# Altium project ArmBand-Control-Board.PrjPcb (part 1 of 3)
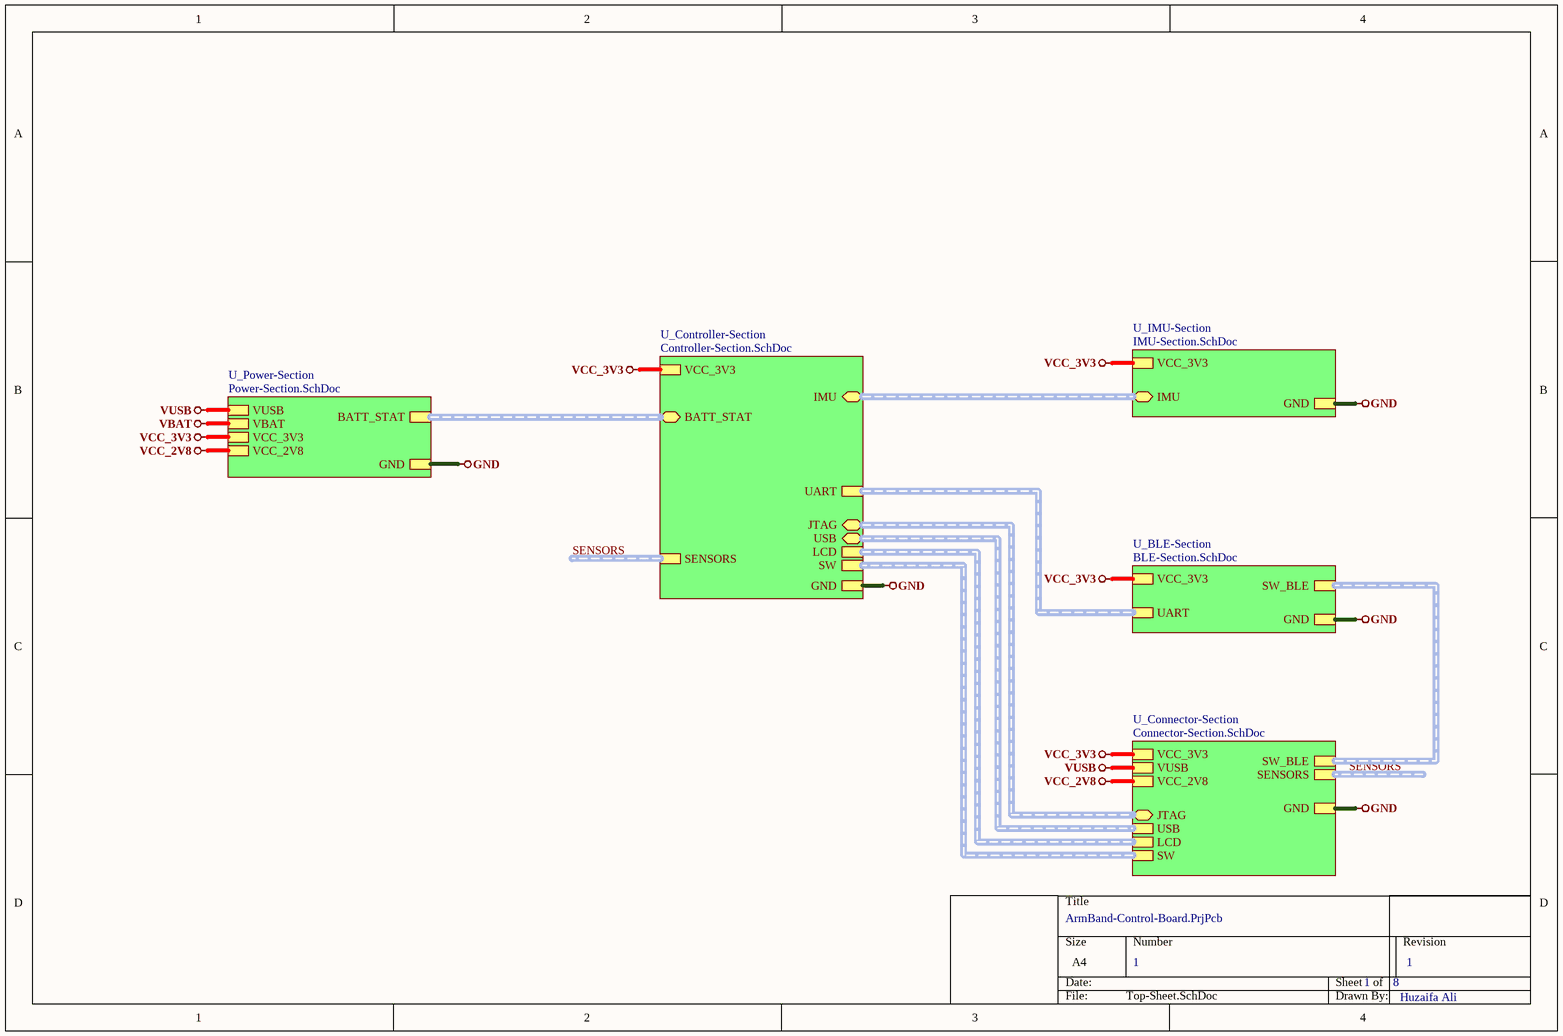
[diagram p0: Top-Sheet.SchDoc]
8 sheets, 111 parts. Net scope: hierarchical (ports join the sheet entries above them; power ports are global).
Board file: ArmBand-Control-Board.PcbDoc
Sheets:
  Top-Sheet.SchDoc
    U_Power-Section = Power-Section.SchDoc
      U_Switching-Regulators = Switching-Regulators.SchDoc
      U_Battery-Charging-Section = Battery-Charging-Section.SchDoc
    U_Controller-Section = Controller-Section.SchDoc
    U_IMU-Section = IMU-Section.SchDoc
    U_BLE-Section = BLE-Section.SchDoc
    U_Connector-Section = Connector-Section.SchDoc

## Sheet Top-Sheet.SchDoc
size A4; SheetNumber: 1; SheetTotal: 8

### Sub-sheets
U_BLE-Section = BLE-Section.SchDoc: UART (harness UART), SW_BLE (harness SW_BLE), VCC_3V3, GND
U_Connector-Section = Connector-Section.SchDoc: SW_BLE (harness SW_BLE), USB (harness USB), VCC_3V3, GND, VUSB, JTAG (bidir, harness JTAG), LCD (harness LCD), SENSORS (harness SENSORS), VCC_2V8, SW (harness SW)
U_Controller-Section = Controller-Section.SchDoc: BATT_STAT (bidir, harness BATT_STAT), IMU (bidir, harness IMU), USB (bidir, harness USB), VCC_3V3, GND, UART (harness UART), JTAG (bidir, harness JTAG), LCD (harness LCD), SENSORS (harness SENSORS), SW (harness SW)
U_IMU-Section = IMU-Section.SchDoc: IMU (bidir, harness IMU), VCC_3V3, GND
U_Power-Section = Power-Section.SchDoc: VUSB, GND, VBAT, VCC_3V3, BATT_STAT (harness BATT_STAT), VCC_2V8

### Nets
GND: sheet U_Power-Section/GND, sheet U_Controller-Section/GND, sheet U_IMU-Section/GND, sheet U_BLE-Section/GND, sheet U_Connector-Section/GND
VCC_2V8: sheet U_Power-Section/VCC_2V8, sheet U_Connector-Section/VCC_2V8
VCC_3V3: sheet U_Power-Section/VCC_3V3, sheet U_Controller-Section/VCC_3V3, sheet U_IMU-Section/VCC_3V3, sheet U_BLE-Section/VCC_3V3, sheet U_Connector-Section/VCC_3V3
VUSB: sheet U_Power-Section/VUSB, sheet U_Connector-Section/VUSB

### Buses and harness runs
harness SENSORS = sheet U_Connector-Section/SENSORS
harness SENSORS = sheet U_Controller-Section/SENSORS
harness sheet U_BLE-Section/SW_BLE = sheet U_Connector-Section/SW_BLE
harness sheet U_BLE-Section/UART = sheet U_Controller-Section/UART
harness sheet U_Connector-Section/JTAG = sheet U_Controller-Section/JTAG
harness sheet U_Connector-Section/LCD = sheet U_Controller-Section/LCD
harness sheet U_Connector-Section/SW = sheet U_Controller-Section/SW
harness sheet U_Connector-Section/USB = sheet U_Controller-Section/USB
harness sheet U_Controller-Section/BATT_STAT = sheet U_Power-Section/BATT_STAT
harness sheet U_Controller-Section/IMU = sheet U_IMU-Section/IMU

### Notes on the sheet
- 1
- Huzaifa Ali

## Sheet Power-Section.SchDoc
size A4; SheetNumber: 2; SheetTotal: 8
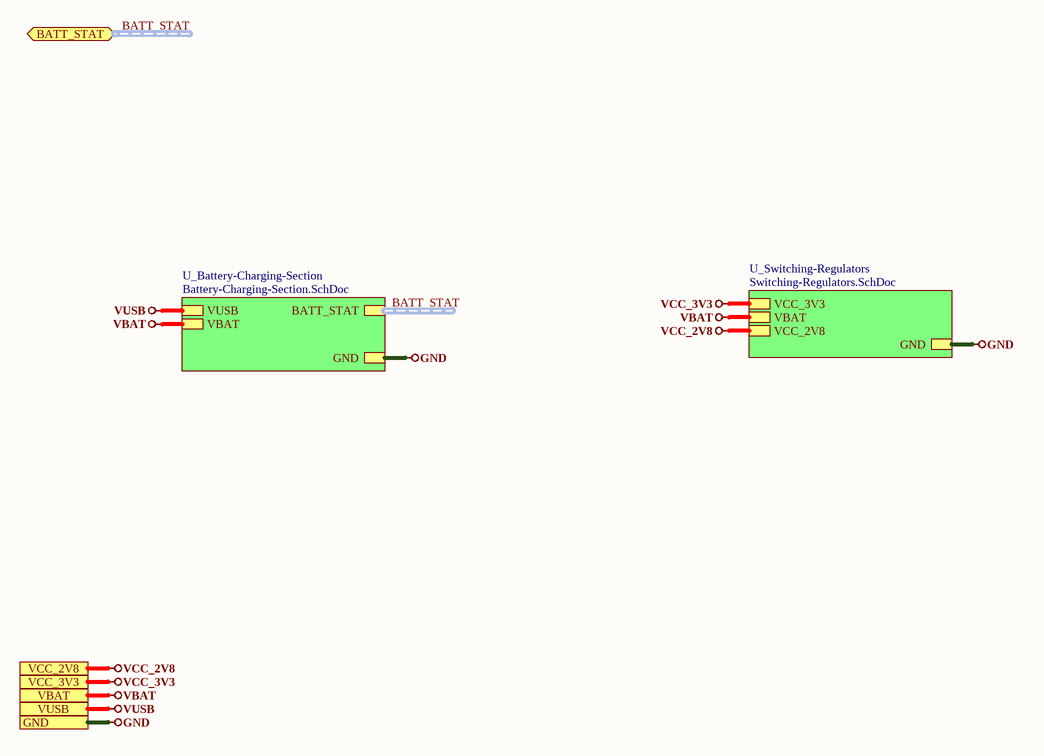
[diagram p1: Power-Section.SchDoc]

### Sub-sheets
U_Battery-Charging-Section = Battery-Charging-Section.SchDoc: BATT_STAT (harness BATT_STAT), VUSB, GND, VBAT
U_Switching-Regulators = Switching-Regulators.SchDoc: VCC_3V3, GND, VBAT, VCC_2V8

### Ports
BATT_STAT (bidir, harness BATT_STAT), GND, VBAT, VCC_2V8, VCC_3V3, VUSB

### Nets
GND: port GND, sheet U_Switching-Regulators/GND, sheet U_Battery-Charging-Section/GND
VBAT: port VBAT, sheet U_Switching-Regulators/VBAT, sheet U_Battery-Charging-Section/VBAT
VCC_2V8: port VCC_2V8, sheet U_Switching-Regulators/VCC_2V8
VCC_3V3: port VCC_3V3, sheet U_Switching-Regulators/VCC_3V3
VUSB: port VUSB, sheet U_Battery-Charging-Section/VUSB

### Buses and harness runs
harness BATT_STAT = port BATT_STAT
harness BATT_STAT = sheet U_Battery-Charging-Section/BATT_STAT

### Notes on the sheet
- 1
- Huzaifa Ali

## Sheet Switching-Regulators.SchDoc
size A4; SheetNumber: 4; SheetTotal: 8
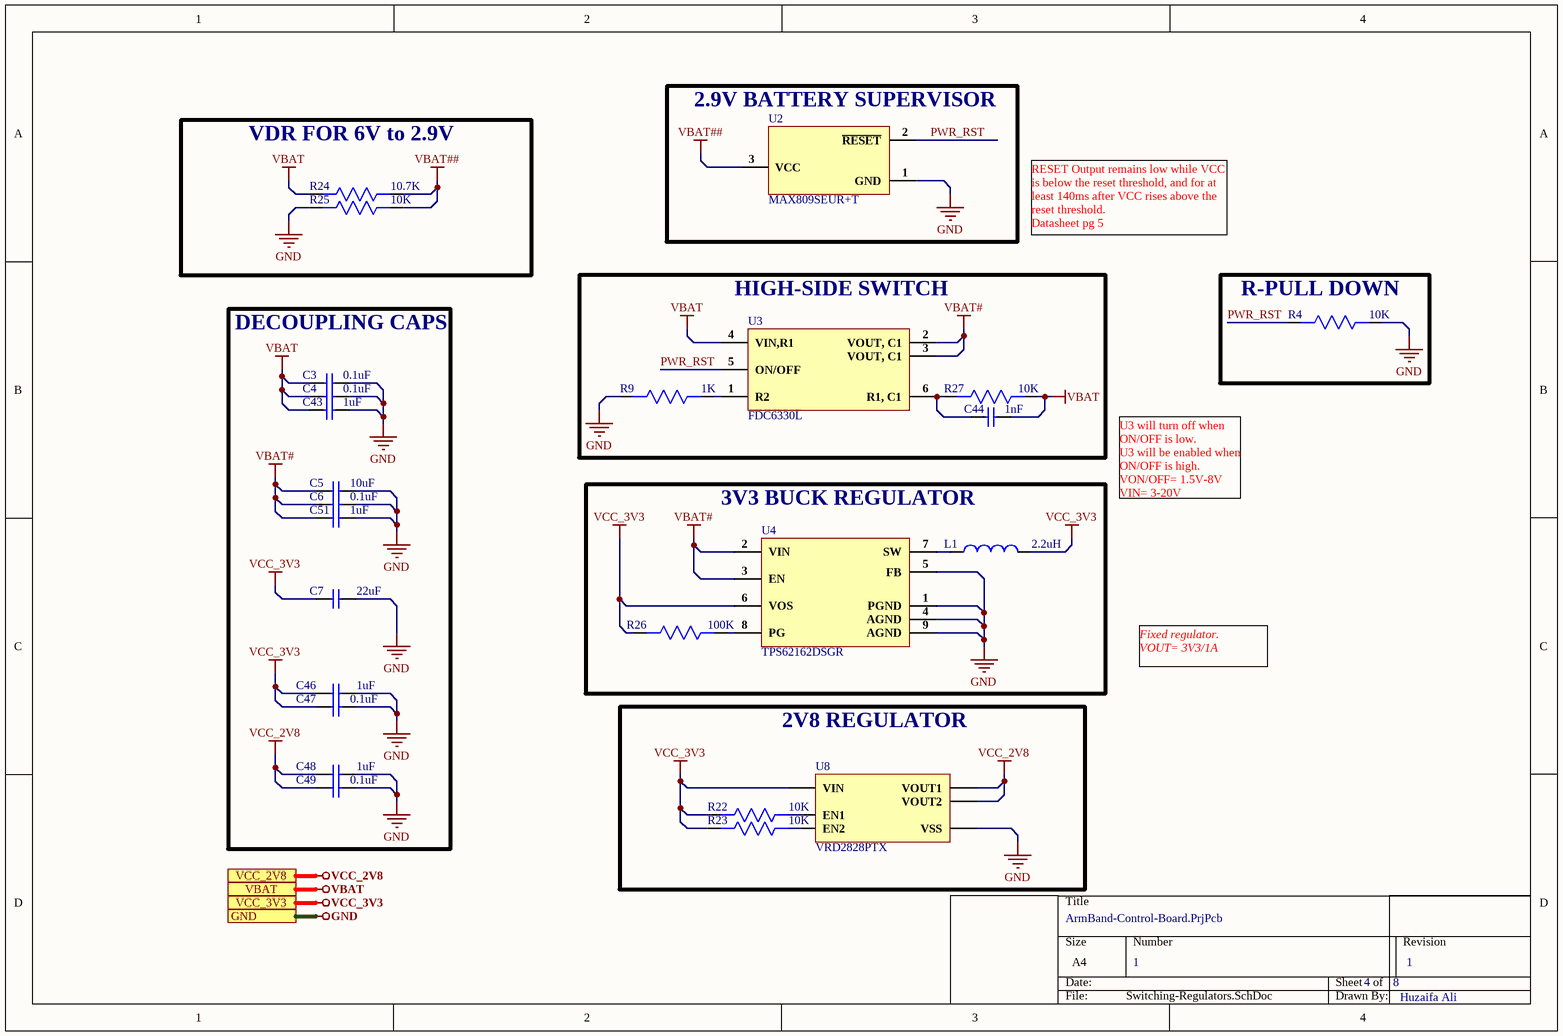
[diagram p2: Switching-Regulators.SchDoc]

### Parts
C3  0.1uF  [Cap 0402]
C4  0.1uF  [Cap 0402]
C5  10uF  [Cap0603]
C6  0.1uF  [Cap 0402]
C7  22uF  [Cap0805]
C43  1uF  [Cap 0402]
C44  1nF  [Cap 0402]
C46  1uF  [Cap 0402]
C47  0.1uF  [Cap 0402]
C48  1uF  [Cap 0402]
C49  0.1uF  [Cap 0402]
C51  1uF  [Cap 0402]
L1  2.2uH  [MAKK2016T2R2M]
R4  10K  [Res0402]
R9  1K  [Res0402]
R22  10K  [Res0402]
R23  10K  [Res0402]
R24  10.7K  [Res0402]
R25  10K  [Res0402]
R26  100K  [Res0402]
R27  10K  [Res0402]
U2  MAX809SEUR+T  [SOT-23]
U3  FDC6330L  [SuperSOT™-6]
U4  TPS62162DSGR  [8-WSON (2x2)]
U8  VRD2828PTX  [SOT-23-6]

### Blocks framed on the sheet
2.9V BATTERY SUPERVISOR: U2
VDR FOR 6V to 2.9V: R24 R25
HIGH-SIDE SWITCH: C44 R9 R27 U3
R-PULL DOWN: R4
DECOUPLING CAPS: C3-C7 C43 C46-C49 C51
3V3 BUCK REGULATOR: L1 R26 U4
2V8 REGULATOR: R22 R23 U8

### Ports
GND, VBAT, VCC_2V8, VCC_3V3

### Nets
GND: C3.2 C4.2 C5.2 C6.2 C7.2 C43.2 C46.2 C47.2 C48.2 C49.2 C51.2 R4.1 R9.2 R25.2 U2.1(GND) U4.1(PGND) U4.4(AGND) U4.5(FB) U4.9(AGND) U8.5(VSS) ; port GND
VBAT: C3.1 C4.1 C43.1 C44.2 R24.2 R27.1 U3.4(VIN,R1) ; port VBAT
VBAT#: C5.1 C6.1 C51.1 U3.2(VOUT,_C1) U3.3(VOUT,_C1) U4.2(VIN) U4.3(EN)
VBAT##: R24.1 R25.1 U2.3(VCC)
VCC_2V8: C48.1 C49.1 U8.4(VOUT2) U8.6(VOUT1) ; port VCC_2V8
VCC_3V3: C7.1 C46.1 C47.1 L1.2 R22.1 R23.1 R26.2 U4.6(VOS) U8.2(VIN) ; port VCC_3V3
PWR_RST: R4.2 U2.2(~{RESET}) U3.5(ON/OFF)
NetC44_1: C44.1 R27.2 U3.6(R1,_C1)
NetL1_1: L1.1 U4.7(SW)
NetR9_1: R9.1 U3.1(R2)
NetR22_2: R22.2 U8.1(EN1)
NetR23_2: R23.2 U8.3(EN2)
NetR26_1: R26.1 U4.8(PG)

### Notes on the sheet
- RESET Output remains low while VCC
  is below the reset threshold, and for at
  least 140ms after VCC rises above the
  reset threshold.
  Datasheet pg 5
- U3 will turn off when ON/OFF is low.
  U3 will be enabled when ON/OFF is high.
  VON/OFF= 1.5V-8V
  VIN= 3-20V
- Fixed regulator.
  VOUT= 3V3/1A
- 1
- Huzaifa Ali

### Library data of the parts
C3 C4 C6 C47 C49 = GRM155R71H104ME14D: CAP CER 0.1UF 50V X7R 0402; Manufacturer: Murata; Tolerance: 20%; Capacitance: 100nF; Supplier 1: Digi-Key; Manufacturer Part Number: GRM155R71H104ME14D; Stock 1: 439844; Pricing 1: 1=0.1, 10=0.038, 100=0.0168, 500=0.01198, 1000=0.00941, 2500=0.00855, 5000=0.00787 (USD); Mount: Surface Mount; Case/Package: 0402; Min Operating Temperature: -55°C; Max Operating Temperature: 125°C; Packaging: Cut Tape; Voltage Rating: 50V; Length: 0.039inch; Width: 0.02inch; Thickness: 0.022inch; ComponentLink1URL: http://search.murata.co.jp/Ceramy/image/img/A01X/G101/ENG/GRM155R71H104ME14-01.pdf?src-supplier=Digi-Key; ComponentLink1Description: http://search.murata.co.jp/Ceramy/image/img/A01X/G101/ENG/GRM155R71H104ME14-01.pdf?src-supplier=Digi-Key; ComponentLink2URL: http://psearch.en.murata.com/capacitor/product/GRM155R71H104ME14%23.pdf?src-supplier=Avnet; ComponentLink2Description: http://psearch.en.murata.com/capacitor/product/GRM155R71H104ME14%23.pdf?src-supplier=Avnet; ComponentLink3URL: http://components.arrow.com/part/dataview/0323_07177683?src-supplier=Arrow+Europe; ComponentLink3Description: http://components.arrow.com/part/dataview/0323_07177683?src-supplier=Arrow+Europe; ComponentLink4URL: http://www.mouser.com/ds/2/281/c02e-2905.pdf?src-supplier=Mouser; ComponentLink4Description: http://www.mouser.com/ds/2/281/c02e-2905.pdf?src-supplier=Mouser; Supplier Part Number 1: 490-10701-1-ND
C5 = CL10A106MA8NRNC: CAP CER 10UF 25V X5R 0603; Manufacturer: Samsung; Tolerance: 20%; Supplier 1: Avnet; Manufacturer Part Number: CL10A106MA8NRNC; RoHS: Yes; Category: Ceramic Capacitors; Pricing 1: 4000=0.03753, 8000=0.03700, 16000=0.03595, 24000=0.03515, 32000=0.03383, 40000=0.03304, 400000=0.03225 (USD); Mount: Surface Mount; Case/Package: 0603; Case Code (Metric): 1608; Case Code (Imperial): 0603; Contact Plating: Tin; Min Operating Temperature: -55°C; Max Operating Temperature: 85°C; Package Quantity: 1; Packaging: Tape and Reel; Capacitance: 10uF; Voltage Rating: 25V; Dielectric: X5R; Termination: Wraparound; Series: CL; Construction: Flat; Length: 0.063inch; Width: 0.031inch; Thickness: 0.035inch; Lead Free: Lead Free; RoHS Compliant: Yes; ComponentLink1URL: https://datasheet.ciiva.com/25766/cl10a106ma8nrnc-25766562.pdf?src-supplier=Digi-Key; ComponentLink1Description: https://datasheet.ciiva.com/25766/cl10a106ma8nrnc-25766562.pdf?src-supplier=Digi-Key; Supplier Part Number 1: CL10A106MA8NRNC
C7 = GRM21BR61E226ME44L: CAP CER 22UF 25V X5R 0805; Manufacturer: Murata; Material: Ceramic; Tolerance: 20%; Supplier 1: Arrow Electronics; Manufacturer Part Number: GRM21BR61E226ME44L; RoHS: Yes; Category: Ceramic Capacitors; Stock 1: 21193; Pricing 1: 1=0.45930, 10=0.35000, 25=0.33950, 50=0.26910, 100=0.22090, 250=0.21320, 500=0.16760, 1000=0.14640, 3000=0.11710, 6000=0.10550, 15000=0.10450 (USD); Mount: Surface Mount; Case/Package: 0805; Case Code (Metric): 2012; Case Code (Imperial): 0805; Weight: 0.000335oz; Min Operating Temperature: -55°C; Max Operating Temperature: 85°C; Capacitance: 22uF; Voltage Rating: 25V; Packaging: Tape and Reel; Dielectric: X5R; Voltage: 25V; Termination: SMD/SMT; Resistor Type: Ceramic; Voltage Rating (DC): 25V; Package Quantity: 3000; Series: GRM; Construction: Flat; Length: 2mm; Width: 1.25mm; Height: 1.25mm; Thickness: 0.057inch; Depth: 1.25mm; REACH SVHC: No SVHC; Lead Free: Lead Free; RoHS Compliant: Yes; ComponentLink1URL: https://datasheet.ciiva.com/22787/1747471-22787265.pdf?src-supplier=Farnell; ComponentLink1Description: https://datasheet.ciiva.com/22787/1747471-22787265.pdf?src-supplier=Farnell; ComponentLink2URL: https://datasheet.ciiva.com/7719/1747471-7719095.pdf?src-supplier=Element14; ComponentLink2Description: https://datasheet.ciiva.com/7719/1747471-7719095.pdf?src-supplier=Element14; ComponentLink3URL: https://datasheet.ciiva.com/28584/1747471-28584199.pdf?src-supplier=Element14; ComponentLink3Description: https://datasheet.ciiva.com/28584/1747471-28584199.pdf?src-supplier=Element14; Supplier Part Number 1: GRM21BR61E226ME44L
C43 C46 C48 C51 = CC0402KRX5R7BB105: CAP CER 1UF 16V X5R 0402; Manufacturer: Yageo; Tolerance: 10%; Supplier 1: Digi-Key; Manufacturer Part Number: CC0402KRX5R7BB105; Stock 1: 1405667; Pricing 1: 1=0.36, 10=0.252, 100=0.1512, 500=0.1134, 1000=0.09576, 2500=0.09072, 5000=0.08568 (USD); Mount: Surface Mount; Case/Package: 0402; Weight: 2.3E-05oz; Case Code (Imperial): 0402; Case Code (Metric): 1005; Min Operating Temperature: -55°C; Max Operating Temperature: 85°C; Capacitance: 1uF; Dielectric: X5R; Packaging: Tape and Reel; Voltage Rating (DC): 16V; Voltage Rating: 16V; Termination: SMD/SMT; Composition: Ceramic; Length: 1mm; Height: 0.5mm; Width: 0.02inch; Thickness: 0.022inch; Depth: 0.5mm; Radiation Hardening: No; Lead Free: Lead Free; Halogen Free: Halogen Free; ComponentLink1URL: http://www.yageo.com/documents/recent/UPY-GPHC_X5R_4V-to-50V_12.pdf?src-supplier=Avnet+Europe; ComponentLink1Description: http://www.yageo.com/documents/recent/UPY-GPHC_X5R_4V-to-50V_12.pdf?src-supplier=Avnet+Europe; Supplier Part Number 1: 311-1691-6-ND
C44 = CC0402KRX7R8BB102: CAP CER 1000PF 25V X7R 0402; Manufacturer: Yageo; Tolerance: 10%; Dissipation Factor: 2.5%; Insulation Resistance: 10GR; Supplier 1: Arrow Electronics; Manufacturer Part Number: CC0402KRX7R8BB102; RoHS: Yes; Category: Ceramic Capacitors; Stock 1: 370000; Pricing 1: 1=0.00230, 10000=0.00230, 100001=0.00190 (USD); Mount: Surface Mount; Case/Package: 0402; Number of Pins: 2; Case Code (Imperial): 0402; Case Code (Metric): 1005; Min Operating Temperature: -55°C; Max Operating Temperature: 125°C; Capacitance: 1nF; Packaging: Tape and Reel; Voltage Rating: 25V; Dielectric: X7R; Termination: SMD/SMT; Voltage Rating (DC): 25V; Series: CC; Length: 1mm; Width: 0.02inch; Thickness: 0.022inch; Depth: 0.5mm; Radiation Hardening: No; Lead Free: Lead Free; Halogen Free: Halogen Free; RoHS Compliant: Yes; ComponentLink1URL: https://datasheet.ciiva.com/26862/getdatasheetpartid-639817-26862638.pdf?src-supplier=Verical; ComponentLink1Description: https://datasheet.ciiva.com/26862/getdatasheetpartid-639817-26862638.pdf?src-supplier=Verical; ComponentLink2URL: https://datasheet.ciiva.com/5425/upy-gp-np0-16v-to-50v-8-3714-5425527.pdf?src-supplier=Mouser; ComponentLink2Description: https://datasheet.ciiva.com/5425/upy-gp-np0-16v-to-50v-8-3714-5425527.pdf?src-supplier=Mouser; Supplier Part Number 1: CC0402KRX7R8BB102
L1 = MAKK2016T2R2M: FIXED IND 2.2UH 1.5A 160MOHM SMD; Manufacturer: Taiyo Yuden; Core Material: Metal; Tolerance: 20%; Shielding: Shielded; DC Resistance (DCR): 160mR; Test Frequency: 2MHz; Supplier 1: Mouser; Manufacturer Part Number: MAKK2016T2R2M; RoHS: Yes; Category: Fixed Inductors; Stock 1: 64320; Pricing 1: 1=0.27000, 10=0.17200, 50=0.17200, 100=0.14000, 1000=0.10600, 10000=0.09200 (USD); Mount: Surface Mount; Case/Package: 0806; Case Code (Metric): 2016; Case Code (Imperial): 0806; Min Operating Temperature: -40°C; Max Operating Temperature: 105°C; Packaging: Tape and Reel; Package Quantity: 3000; Resistor Type: Wirewound; Inductance: 2.2uH; Current Rating: 1.5A; Saturation Current: 1.5A; Max DC Current: 1.5A; Termination: SMD/SMT; Length: 0.079inch; Width: 0.063inch; Height: 1mm; Height - Seated (Max): 0.039inch; Depth: 1.6mm; Radiation Hardening: No; Halogen Free: Halogen Free; RoHS Compliant: Yes; ComponentLink1URL: https://datasheet.ciiva.com/30014/makk2016t2r2m-ss-30014449.pdf?src-supplier=Avnet; ComponentLink1Description: https://datasheet.ciiva.com/30014/makk2016t2r2m-ss-30014449.pdf?src-supplier=Avnet; Supplier Part Number 1: 963-MAKK2016T2R2M
R4 R22 R23 R25 R27 = RC0402FR-0710KL: RES SMD 10K OHM 1% 1/16W 0402; Manufacturer: Yageo; Resistance: 10kR; Temperature Coefficient: 100ppm/°C; Voltage Rating (DC): 50V; Power Rating: 62.5mW; Supplier 1: Digi-Key; Manufacturer Part Number: RC0402FR-0710KL; Stock 1: 60122563; Pricing 1: 1=0.1, 10=0.016, 100=0.0064, 1000=0.00289, 2500=0.00251, 5000=0.00207 (USD); Case/Package: 0402; Number of Pins: 2; Case Code (Imperial): 0402; Case Code (Metric): 1005; Min Operating Temperature: -55°C; Max Operating Temperature: 155°C; Composition: Thick Film; Tolerance: 1%; Packaging: Tape and Reel; Voltage Rating: 50V; Termination: SMD/SMT; Military Standard: Not; Working Voltage: 50V; Number of Terminations: 2; Length: 1mm; Height: 0.32mm; Width: 0.5mm; Depth: 0.5mm; Lead Pitch: 0.2mm; REACH SVHC: No SVHC; Lead Free: Lead Free; ComponentLink1URL: http://www.farnell.com/datasheets/2167052.pdf?src-supplier=Element14; ComponentLink1Description: http://www.farnell.com/datasheets/2167052.pdf?src-supplier=Element14; ComponentLink2URL: http://www.farnell.com/datasheets/1686128.pdf?src-supplier=Element14; ComponentLink2Description: http://www.farnell.com/datasheets/1686128.pdf?src-supplier=Element14; ComponentLink3URL: http://www.farnell.com/datasheets/1784430.pdf?src-supplier=Element14; ComponentLink3Description: http://www.farnell.com/datasheets/1784430.pdf?src-supplier=Element14; ComponentLink4URL: http://www.yageo.com/documents/recent/PYu-RC_Group_51_RoHS_L_9.pdf?src-supplier=Mouser; ComponentLink4Description: http://www.yageo.com/documents/recent/PYu-RC_Group_51_RoHS_L_9.pdf?src-supplier=Mouser; Supplier Part Number 1: 311-10.0KLRDKR-ND
R9 = RC0402JR-071KL: RES 1K OHM 5% 1/16W 0402; Manufacturer: Yageo; Resistance: 1kR; Power Rating: 62.5mW; Voltage Rating: 50V; Temperature Coefficient: 100ppm/°C; Max Power Dissipation: 63mW; Supplier 1: Digi-Key; Manufacturer Part Number: RC0402JR-071KL; RoHS: Yes; Category: Chip SMD Resistors; Stock 1: 452315; Pricing 1: 1=0.10000, 10=0.01300, 100=0.00540, 1000=0.00244, 2500=0.00212, 5000=0.00175 (USD); Case/Package: 0402; Case Code (Imperial): 0402; Case Code (Metric): 1005; Size Code: 0402; Min Operating Temperature: -55°C; Max Operating Temperature: 155°C; Tolerance: 5%; Packaging: Tape and Reel; Package Quantity: 1; Termination: SMD/SMT; Resistor Type: Thick Film; Number of Terminations: 2; Features: Moisture Resistant; Series: RC; Resistance Tolerance: 5%; Construction: Rectangular; Length: 0.039inch; Width: 0.02inch; Height: 0.016inch; Depth: 0.5mm; REACH SVHC: No SVHC; Military Standard: Not; Lead Free: Lead Free; RoHS Compliant: Yes; ComponentLink1URL: https://datasheet.ciiva.com/7983/1018594-7983558.pdf?src-supplier=Element14; ComponentLink1Description: https://datasheet.ciiva.com/7983/1018594-7983558.pdf?src-supplier=Element14; ComponentLink2URL: https://datasheet.ciiva.com/2452/pyu-r-int-thick-7-2452756.pdf?src-supplier=Digi-Key; ComponentLink2Description: https://datasheet.ciiva.com/2452/pyu-r-int-thick-7-2452756.pdf?src-supplier=Digi-Key; ComponentLink3URL: https://datasheet.ciiva.com/2452/pyu-r-int-thick-7-2452757.pdf?src-supplier=Digi-Key; ComponentLink3Description: https://datasheet.ciiva.com/2452/pyu-r-int-thick-7-2452757.pdf?src-supplier=Digi-Key; ComponentLink4URL: https://datasheet.ciiva.com/2452/pyu-r-int-thick-7-2452755.pdf?src-supplier=Digi-Key; ComponentLink4Description: https://datasheet.ciiva.com/2452/pyu-r-int-thick-7-2452755.pdf?src-supplier=Digi-Key; ComponentLink5URL: https://datasheet.ciiva.com/7850/1018594-7850170.pdf?src-supplier=Element14; ComponentLink5Description: https://datasheet.ciiva.com/7850/1018594-7850170.pdf?src-supplier=Element14; ComponentLink6URL: https://datasheet.ciiva.com/7850/1018594-7850171.pdf?src-supplier=Element14; ComponentLink6Description: https://datasheet.ciiva.com/7850/1018594-7850171.pdf?src-supplier=Element14; ComponentLink7URL: https://datasheet.ciiva.com/17081/pyu-rc0402-51-rohs-l-6-r-17081438.pdf?src-supplier=Future+Electronics; ComponentLink7Description: https://datasheet.ciiva.com/17081/pyu-rc0402-51-rohs-l-6-r-17081438.pdf?src-supplier=Future+Electronics; Supplier Part Number 1: 311-1.0KJRCT-ND
R24 = AC0402DR-0710K7L: RES SMD 0402 10.7kOhm 0.5% Paper T/R; Manufacturer: Yageo; Supplier 1: Avnet; Manufacturer Part Number: AC0402DR-0710K7L; RoHS: Yes; Category: Chip SMD Resistors; Pricing 1: 10000=0.00820 (USD); RoHS Compliant: Yes; Supplier Part Number 1: AC0402DR-0710K7L
R26 = ERJPA2F1003X: RES SMD 100K OHM 1% 1/5W 0402; Manufacturer: Panasonic; Manufacturer Part Number: ERJ-PA2F1003X; Resistance: 100kR; Power Rating: 200mW; Voltage Rating: 50V; Temperature Coefficient: 100ppm/°C; Supplier 1: Digi-Key; Stock 1: 8829; Pricing 1: 1=0.21, 10=0.175, 100=0.0686, 1000=0.02871, 2500=0.02632, 5000=0.02393 (USD); Case/Package: 0402; Case Code (Metric): 1005; Case Code (Imperial): 0402; Min Operating Temperature: -55°C; Max Operating Temperature: 155°C; Packaging: Cut Tape; Composition: Thick Film; Number of Terminations: 2; Tolerance: 1%; Max Power Dissipation: 200mW; Voltage Rating (DC): 50V; Features: Automotive AEC-Q200; Length: 0.039inch; Height: 0.016inch; Width: 0.02inch; REACH SVHC: Unknown; ComponentLink1URL: http://www.farnell.com/datasheets/2051174.pdf?src-supplier=Element14; ComponentLink1Description: http://www.farnell.com/datasheets/2051174.pdf?src-supplier=Element14; ComponentLink2URL: https://industrial.panasonic.com/ww/system/files/data/download/catalog/id_fixed-resistors_e_1.pdf?src-supplier=Digi-Key; ComponentLink2Description: https://industrial.panasonic.com/ww/system/files/data/download/catalog/id_fixed-resistors_e_1.pdf?src-supplier=Digi-Key; Supplier Part Number 1: P17236CT-ND
U2 = MAX809SEUR+T: IC MPU/RESET CIRC SOT23-3; Manufacturer: Maxim; Min Supply Voltage: 1.2V; Max Supply Voltage: 5.5V; Max Power Dissipation: 320mW; Number of Voltages Monitored: 1; Reset: Active Low; Reset Timeout: 140ms; Threshold Voltage: 2.93V; Watchdog Timer: No; Min Reset Threshold Voltage: 2.89V; Max Reset Threshold Voltage: 2.96V; Output: TOTEM-POLE; Operating Supply Current: 60uA; Max Output Current: 20mA; Nominal Supply Current: 17uA; Output Type: PUSH-PULL; Supplier 1: Mouser; Manufacturer Part Number: MAX809SEUR+T; RoHS: Yes; Category: Voltage Supervisors; Stock 1: 26180; Pricing 1: 1=3.68000, 10=3.31000, 25=3.13000, 50=3.13000, 100=2.72000, 250=2.58000, 500=2.31000, 1000=2.09000, 10000=2.01000 (USD); Mount: Surface Mount; Case/Package: SOT-23; Number of Pins: 3; Min Operating Temperature: -40°C; Max Operating Temperature: 105°C; Type: Simple Reset/Power-On Reset; Packaging: Cut Tape; Package Quantity: 1; Series: -; Overvoltage Threshold: 2.96V; Undervoltage Threshold: 2.89V; Termination: SMD/SMT; Power Dissipation: 320mW; Length: 2.92mm; Width: 1.3mm; Height: 0.94mm; Radiation Hardening: No; Lead Free: Lead Free; RoHS Compliant: Yes; REACH SVHC: No SVHC; ComponentLink1URL: https://datasheet.ciiva.com/1169/max803-max810z-1169879.pdf?src-supplier=Element14; ComponentLink1Description: https://datasheet.ciiva.com/1169/max803-max810z-1169879.pdf?src-supplier=Element14; ComponentLink2URL: https://datasheet.ciiva.com/1169/max803-max810z-1169878.pdf?src-supplier=Element14; ComponentLink2Description: https://datasheet.ciiva.com/1169/max803-max810z-1169878.pdf?src-supplier=Element14; ComponentLink3URL: https://datasheet.ciiva.com/14226/max803-max810z-14226330.pdf?src-supplier=Avnet; ComponentLink3Description: https://datasheet.ciiva.com/14226/max803-max810z-14226330.pdf?src-supplier=Avnet; ComponentLink4URL: https://datasheet.ciiva.com/1973/max803-max810z-1973322.pdf?src-supplier=Digi-Key; ComponentLink4Description: https://datasheet.ciiva.com/1973/max803-max810z-1973322.pdf?src-supplier=Digi-Key; ComponentLink5URL: https://datasheet.ciiva.com/1973/max803-max810z-1973323.pdf?src-supplier=Digi-Key; ComponentLink5Description: https://datasheet.ciiva.com/1973/max803-max810z-1973323.pdf?src-supplier=Digi-Key; ComponentLink6URL: https://datasheet.ciiva.com/1973/max803-max810z-1973321.pdf?src-supplier=Digi-Key; ComponentLink6Description: https://datasheet.ciiva.com/1973/max803-max810z-1973321.pdf?src-supplier=Digi-Key; Supplier Part Number 1: 700-MAX809SEURT
U3 = FDC6330L: IC PWR SWITCH P-CH 1:1 SUPERSOT6; Manufacturer: ON Semiconductor / Fairchild; Max Input Voltage: 20V; Number of Outputs: 1; Max Power Dissipation: 700mW; Output Current: 1.6A; Max Output Current: 2.3A; Min Input Voltage: 3V; On-State Resistance: 80mR; Interface: On/Off; Output Configuration: High Side; Supplier 1: Newark; Manufacturer Part Number: FDC6330L; RoHS: Yes; Category: Hot Swap Controllers; Pricing 1: 1=0.70000, 25=0.57700, 50=0.52400, 100=0.47100, 250=0.43700, 500=0.37200, 1000=0.30700 (USD); Mount: Surface Mount; Case/Package: SOT-23-6; Number of Pins: 6; Weight: 0.036g; Min Operating Temperature: -55°C; Max Operating Temperature: 150°C; Packaging: Tape and Reel; Package Quantity: 3000; Operating Supply Voltage: 20V; Max Supply Voltage: 20V; Min Supply Voltage: 3V; Power Rating: 700mW; Current Rating: 2.3A; Power Dissipation: 700mW; Continuous Drain Current (ID): 2.3A; Drain to Source Voltage (Vdss): 20V; Voltage: 20V; Current: 2.3A; Voltage Rating (DC): 20V; Length: 3mm; Width: 1.7mm; Height: 1mm; Radiation Hardening: No; RoHS Compliant: Yes; REACH SVHC: No SVHC; Lead Free: Lead Free; ComponentLink1URL: https://datasheet.ciiva.com/34302/1222713-34302120.pdf?src-supplier=Jameco; ComponentLink1Description: https://datasheet.ciiva.com/34302/1222713-34302120.pdf?src-supplier=Jameco; ComponentLink2URL: https://datasheet.ciiva.com/4898/fdc6330l-102811-4898611.pdf?src-supplier=Mouser; ComponentLink2Description: https://datasheet.ciiva.com/4898/fdc6330l-102811-4898611.pdf?src-supplier=Mouser; ComponentLink3URL: https://datasheet.ciiva.com/1171/fdc6330l-1171185.pdf?src-supplier=Newark; ComponentLink3Description: https://datasheet.ciiva.com/1171/fdc6330l-1171185.pdf?src-supplier=Newark; ComponentLink4URL: https://datasheet.ciiva.com/1572/276121-1572006.pdf?src-supplier=Farnell; ComponentLink4Description: https://datasheet.ciiva.com/1572/276121-1572006.pdf?src-supplier=Farnell; ComponentLink5URL: https://datasheet.ciiva.com/28483/276121-28483263.pdf?src-supplier=Element14; ComponentLink5Description: https://datasheet.ciiva.com/28483/276121-28483263.pdf?src-supplier=Element14; ComponentLink6URL: https://datasheet.ciiva.com/1512/276121-1512459.pdf?src-supplier=Element14; ComponentLink6Description: https://datasheet.ciiva.com/1512/276121-1512459.pdf?src-supplier=Element14; ComponentLink7URL: https://datasheet.ciiva.com/3232/fdc6330l-3232841.pdf?src-supplier=Avnet; ComponentLink7Description: https://datasheet.ciiva.com/3232/fdc6330l-3232841.pdf?src-supplier=Avnet; ComponentLink8URL: https://datasheet.ciiva.com/17090/fdc6330l-17090428.pdf?src-supplier=Future+Electronics; ComponentLink8Description: https://datasheet.ciiva.com/17090/fdc6330l-17090428.pdf?src-supplier=Future+Electronics; ComponentLink9URL: https://datasheet.ciiva.com/3232/fdc6330l-3232552.pdf?src-supplier=Avnet; ComponentLink9Description: https://datasheet.ciiva.com/3232/fdc6330l-3232552.pdf?src-supplier=Avnet; ComponentLink10URL: https://datasheet.ciiva.com/1962/fdc6330l-1962053.pdf?src-supplier=Digi-Key; ComponentLink10Description: https://datasheet.ciiva.com/1962/fdc6330l-1962053.pdf?src-supplier=Digi-Key; ComponentLink11URL: https://datasheet.ciiva.com/1962/fdc6330l-1962054.pdf?src-supplier=Digi-Key; ComponentLink11Description: https://datasheet.ciiva.com/1962/fdc6330l-1962054.pdf?src-supplier=Digi-Key; ComponentLink12URL: https://datasheet.ciiva.com/1962/fdc6330l-1962052.pdf?src-supplier=Digi-Key; ComponentLink12Description: https://datasheet.ciiva.com/1962/fdc6330l-1962052.pdf?src-supplier=Digi-Key; Supplier Part Number 1: 58K8823
U4 = TPS62162DSGR: Buck Switching Regulator IC Positive Fixed 3.3V 1 Output 1A 8-WFDFN Exposed Pad; Manufacturer: Texas Instruments; Number of Outputs: 1; Max Input Voltage: 17V; Min Input Voltage: 3V; Switching Frequency: 2.25MHz; Synchronous Rectifier: Yes; Quiescent Current: 17uA; Supplier 1: Mouser; Manufacturer Part Number: TPS62162DSGR; RoHS: Yes; Category: Voltage Regulators - Switching; Pricing 1: 1=1.59000, 10=1.44000, 25=1.36000, 50=1.36000, 100=1.16000, 250=1.09000, 500=0.94700, 1000=0.78500, 10000=0.78400 (USD); Case/Package: SOIC; Number of Pins: 8; Contact Plating: Gold; Min Operating Temperature: -40°C; Max Operating Temperature: 125°C; Output Voltage: 3.3V; Packaging: Tape and Reel; Output Current: 1A; Package Quantity: 3000; Max Output Current: 1A; Min Output Voltage: 3.3V; Max Output Voltage: 3.3V; Operating Supply Voltage: 17V; Output Type: Fixed; Output Configuration: Positive; Series: DCS-Control™; Radiation Hardening: No; Lead Free: Lead Free; RoHS Compliant: Yes; ComponentLink1URL: https://datasheet.ciiva.com/2034/tps62161-2034675.pdf?src-supplier=Digi-Key; ComponentLink1Description: https://datasheet.ciiva.com/2034/tps62161-2034675.pdf?src-supplier=Digi-Key; Supplier Part Number 1: 595-TPS62162DSGR
U8 = VRD2828PTX: 300mA 75dB@1kHz 10nA 90mV 2.8V~2.8V 2 6V SOT-23-6 Linear Voltage Regulators (LDO) ROHS; Manufacturer: AnaSem; Manufacturer Part Number: VRD2828PTX; Value: -; Footprint: Custom; ComponentLink1Description: LCSC; ComponentLink1URL: https://lcsc.com/product-detail/Linear-Voltage-Regulators-LDO_AnaSem-VRD2828PTX_C697937.html

## Sheet Battery-Charging-Section.SchDoc
size A4; SheetNumber: 3; SheetTotal: 8
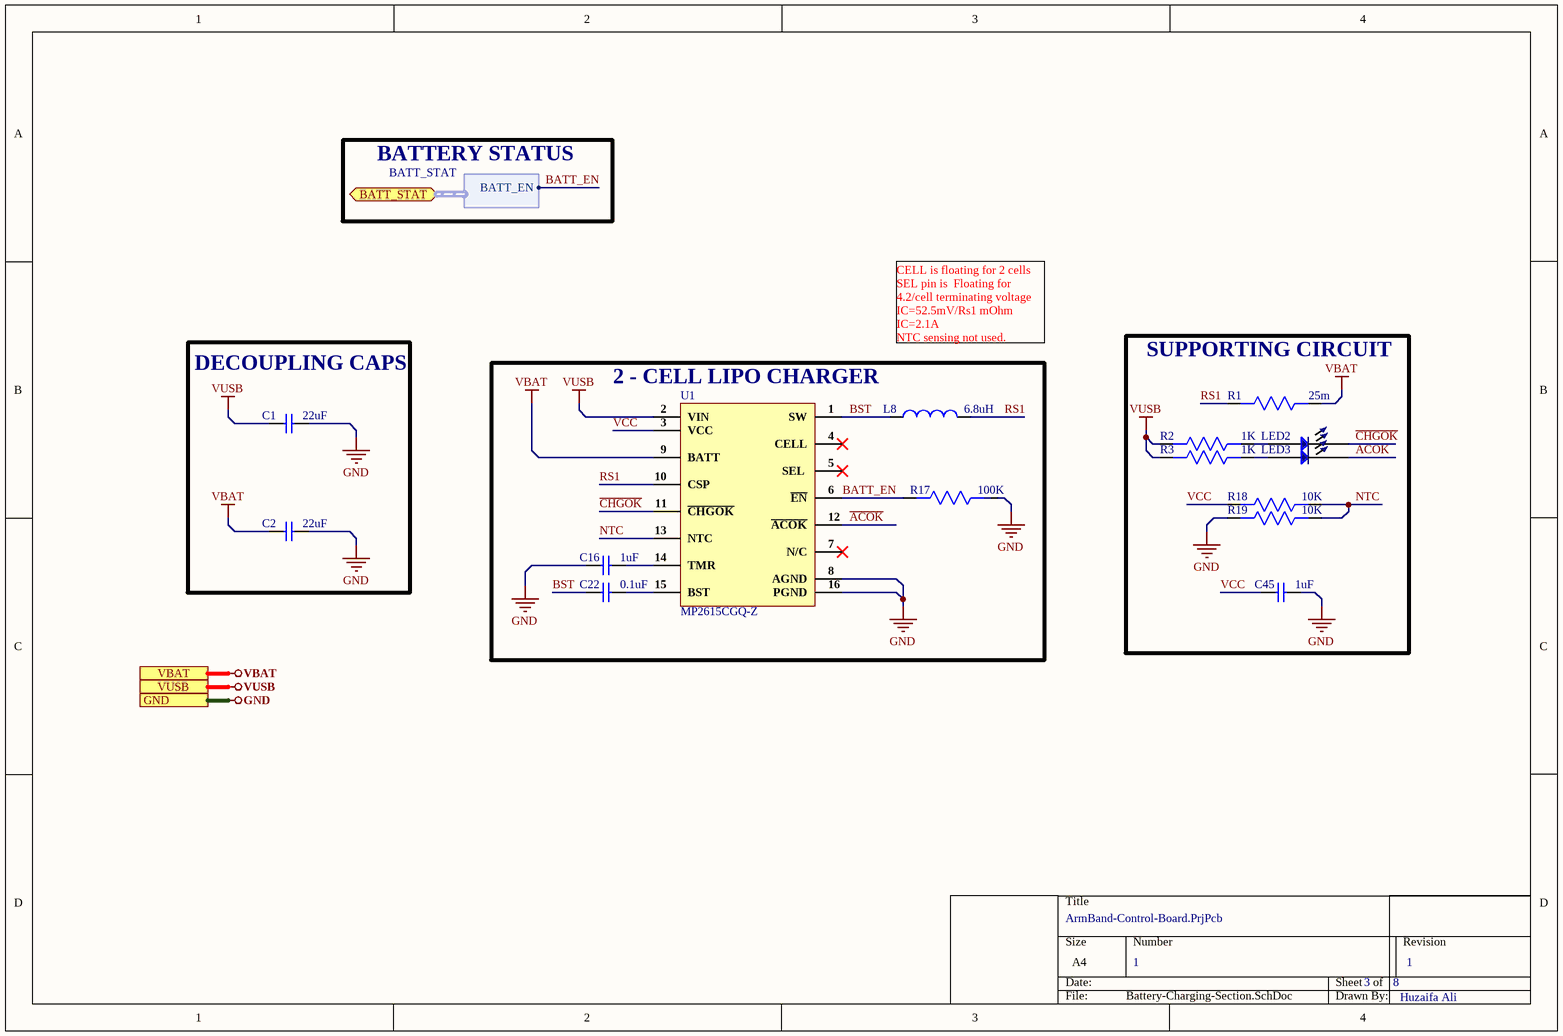
[diagram p3: Battery-Charging-Section.SchDoc]

### Parts
C1  22uF  [Cap0805]
C2  22uF  [Cap0805]
C16  1uF  [Cap 0402]
C22  0.1uF  [Cap 0402]
C45  1uF  [Cap 0402]
L8  6.8uH  [LVC505040-6R8M-N]
LED2  XZMDK68W-2  [LED 0402]  (value not drawn)
LED3  XZVG68W-2  [LED 0402]  (value not drawn)
R1  25m  [RES 0805]
R2  1K  [Res0402]
R3  1K  [Res0402]
R17  100K  [Res0402]
R18  10K  [Res0402]
R19  10K  [Res0402]
U1  MP2615CGQ-Z  [QFN(3X3)]

### Blocks framed on the sheet
DECOUPLING CAPS: C1 C2
SUPPORTING CIRCUIT: C45 LED2 LED3 R1-R3 R18 R19
2 - CELL LIPO CHARGER: C16 C22 L8 R17 U1

### Ports
BATT_STAT (bidir, harness BATT_STAT), GND, VBAT, VUSB

### Harnesses
BATT_STAT: BATT_EN

### Nets
GND: C1.2 C2.2 C16.1 C45.2 R17.1 R19.2 U1.8(AGND) U1.16(PGND) ; port GND
VBAT: C2.1 R1.1 U1.9(BATT) ; port VBAT
VUSB: C1.1 R2.2 R3.2 U1.2(VIN) ; port VUSB
~{ACOK}: LED3.2 U1.12(~{ACOK})
~{CHGOK}: LED2.2 U1.11(~{CHGOK})
BATT_EN: R17.2 U1.6(~{EN}) ; port BATT_STAT.BATT_EN
BST: C22.1 L8.1 U1.1(SW)
NTC: R18.1 R19.1 U1.13(NTC)
RS1: L8.2 R1.2 U1.10(CSP)
VCC: C45.1 R18.2 U1.3(VCC)
NetC16_2: C16.2 U1.14(TMR)
NetC22_2: C22.2 U1.15(BST)
NetLED2_1: LED2.1 R2.1
NetLED3_1: LED3.1 R3.1

Not connected (* = marked no-connect by the designer): U1 4(CELL)* 5(SEL_)* 7(N/C)*

### Notes on the sheet
- BATTERY STATUS
- CELL is floating for 2 cells
  SEL pin is  Floating for 4.2/cell terminating voltage
  IC=52.5mV/Rs1 mOhm
  IC=2.1A
  NTC sensing not used.
- 1
- Huzaifa Ali

### Library data of the parts
C1 C2 = GRM21BR61E226ME44L: 0805 22 uF 25 V ±20% Tolerance X5R SMT Multilayer Ceramic Capacitor; Manufacturer: Murata; Voltage Rating: 25V; Supplier 1: Arrow Electronics; Manufacturer Part Number: GRM21BR61E226ME44L; RoHS: Yes; Category: Ceramic Capacitors; Stock 1: 21193; Pricing 1: 1=0.45930, 10=0.35000, 25=0.33950, 50=0.26910, 100=0.22090, 250=0.21320, 500=0.16760, 1000=0.14640, 3000=0.11710, 6000=0.10550, 15000=0.10450 (USD); Mount: Surface Mount; Case/Package: 0805; Case Code (Metric): 2012; Case Code (Imperial): 0805; Material: Ceramic; Weight: 0.000335oz; Min Operating Temperature: -55°C; Max Operating Temperature: 85°C; Capacitance: 22uF; Tolerance: 20%; Packaging: Tape and Reel; Dielectric: X5R; Voltage: 25V; Termination: SMD/SMT; Resistor Type: Ceramic; Voltage Rating (DC): 25V; Package Quantity: 3000; Series: GRM; Construction: Flat; Length: 2mm; Width: 1.25mm; Height: 1.25mm; Thickness: 0.057inch; Depth: 1.25mm; REACH SVHC: No SVHC; Lead Free: Lead Free; RoHS Compliant: Yes; ComponentLink1URL: https://datasheet.ciiva.com/22787/1747471-22787265.pdf?src-supplier=Farnell; ComponentLink1Description: https://datasheet.ciiva.com/22787/1747471-22787265.pdf?src-supplier=Farnell; ComponentLink2URL: https://datasheet.ciiva.com/7719/1747471-7719095.pdf?src-supplier=Element14; ComponentLink2Description: https://datasheet.ciiva.com/7719/1747471-7719095.pdf?src-supplier=Element14; ComponentLink3URL: https://datasheet.ciiva.com/28584/1747471-28584199.pdf?src-supplier=Element14; ComponentLink3Description: https://datasheet.ciiva.com/28584/1747471-28584199.pdf?src-supplier=Element14; Supplier Part Number 1: GRM21BR61E226ME44L
C16 C45 = CC0402KRX5R7BB105: as C43 on sheet Switching-Regulators; Supplier 1: Digi-Key; Manufacturer Part Number: CC0402KRX5R7BB105; Stock 1: 1405667; Pricing 1: 1=0.36, 10=0.252, 100=0.1512, 500=0.1134, 1000=0.09576, 2500=0.09072, 5000=0.08568 (USD); Mount: Surface Mount; Case/Package: 0402; Weight: 2.3E-05oz; Case Code (Imperial): 0402; Case Code (Metric): 1005; Min Operating Temperature: -55°C; Max Operating Temperature: 85°C; Capacitance: 1uF; Dielectric: X5R; Packaging: Tape and Reel; Voltage Rating (DC): 16V; Voltage Rating: 16V; Termination: SMD/SMT; Composition: Ceramic; Length: 1mm; Height: 0.5mm; Width: 0.02inch; Thickness: 0.022inch; Depth: 0.5mm; Radiation Hardening: No; Lead Free: Lead Free; Halogen Free: Halogen Free; ComponentLink1URL: http://www.yageo.com/documents/recent/UPY-GPHC_X5R_4V-to-50V_12.pdf?src-supplier=Avnet+Europe; ComponentLink1Description: http://www.yageo.com/documents/recent/UPY-GPHC_X5R_4V-to-50V_12.pdf?src-supplier=Avnet+Europe; Supplier Part Number 1: 311-1691-6-ND
C22 = GRM155R71H104ME14D: as C3 on sheet Switching-Regulators; Supplier 1: Digi-Key; Manufacturer Part Number: GRM155R71H104ME14D; Stock 1: 439844; Pricing 1: 1=0.1, 10=0.038, 100=0.0168, 500=0.01198, 1000=0.00941, 2500=0.00855, 5000=0.00787 (USD); Mount: Surface Mount; Case/Package: 0402; Min Operating Temperature: -55°C; Max Operating Temperature: 125°C; Packaging: Cut Tape; Voltage Rating: 50V; Length: 0.039inch; Width: 0.02inch; Thickness: 0.022inch; ComponentLink1URL: http://search.murata.co.jp/Ceramy/image/img/A01X/G101/ENG/GRM155R71H104ME14-01.pdf?src-supplier=Digi-Key; ComponentLink1Description: http://search.murata.co.jp/Ceramy/image/img/A01X/G101/ENG/GRM155R71H104ME14-01.pdf?src-supplier=Digi-Key; ComponentLink2URL: http://psearch.en.murata.com/capacitor/product/GRM155R71H104ME14%23.pdf?src-supplier=Avnet; ComponentLink2Description: http://psearch.en.murata.com/capacitor/product/GRM155R71H104ME14%23.pdf?src-supplier=Avnet; ComponentLink3URL: http://components.arrow.com/part/dataview/0323_07177683?src-supplier=Arrow+Europe; ComponentLink3Description: http://components.arrow.com/part/dataview/0323_07177683?src-supplier=Arrow+Europe; ComponentLink4URL: http://www.mouser.com/ds/2/281/c02e-2905.pdf?src-supplier=Mouser; ComponentLink4Description: http://www.mouser.com/ds/2/281/c02e-2905.pdf?src-supplier=Mouser; Supplier Part Number 1: 490-10701-1-ND
L8 = LVC505040-6R8M-N: 2.7A 6.8uH ±20% 50mΩ SMD Power Inductors ROHS; Manufacturer: Chlisin Elec; ComponentLink1Description: LCSC; ComponentLink1URL: https://www.lcsc.com/product-detail/Power-Inductors_Chilisin-Elec-LVC505040-6R8M-N_C285870.html; Manufacturer Part Number: LVC505040-6R8M-N; Value: 6.8uH; Footprint: Custom
LED2 = XZMDK68W-2: LED RED CLEAR CHIP SMD; Manufacturer: SunLED; Lens Color: Colorless; Luminous Intensity: 69mcd; Test Current: 20mA; Viewing Angle: 120°; Dominant Wavelength: 630nm; Forward Voltage: 1.95V; Supplier 1: Digi-Key; Manufacturer Part Number: XZMDK68W-2; Stock 1: 69539; Pricing 1: 1=0.43, 10=0.306, 100=0.136, 500=0.0952, 1000=0.0782 (USD); Mount: Surface Mount; Case/Package: 0402; Color: Red; Case Code (Metric): 1005; Case Code (Imperial): 0402; Packaging: Tape and Reel; Lens Transparency: Clear; Length: 1mm; Height: 0.6mm; Width: 0.5mm; ComponentLink1URL: http://www.sunledusa.com/products/spec/XZMDK68W-2.pdf?src-supplier=Digi-Key; ComponentLink1Description: http://www.sunledusa.com/products/spec/XZMDK68W-2.pdf?src-supplier=Digi-Key; ComponentLink2URL: https://www.sunledusa.com/products/spec/XZMDK68W-2.pdf?src-supplier=Digi-Key; ComponentLink2Description: https://www.sunledusa.com/products/spec/XZMDK68W-2.pdf?src-supplier=Digi-Key; Supplier Part Number 1: 1497-1174-6-ND
LED3 = XZVG68W-2: LED GREEN CLEAR CHIP SMD; Manufacturer: SunLED; Lens Color: Colorless; Luminous Intensity: 49mcd; Test Current: 20mA; Viewing Angle: 120°; Dominant Wavelength: 570nm; Forward Voltage: 2.1V; Supplier 1: Digi-Key; Manufacturer Part Number: XZVG68W-2; Stock 1: 4185; Pricing 1: 1=0.5, 10=0.36, 100=0.16, 500=0.112, 1000=0.092 (USD); Mount: Surface Mount; Case/Package: 0402; Color: Green; Case Code (Metric): 1005; Case Code (Imperial): 0402; Packaging: Tape and Reel; Lens Transparency: Clear; Length: 1mm; Height: 0.6mm; Width: 0.5mm; ComponentLink1URL: http://www.sunledusa.com/products/spec/XZVG68W-2.pdf?src-supplier=Digi-Key; ComponentLink1Description: http://www.sunledusa.com/products/spec/XZVG68W-2.pdf?src-supplier=Digi-Key; ComponentLink2URL: https://www.sunledusa.com/products/spec/XZVG68W-2.pdf?src-supplier=Digi-Key; ComponentLink2Description: https://www.sunledusa.com/products/spec/XZVG68W-2.pdf?src-supplier=Digi-Key; Supplier Part Number 1: 1497-1219-6-ND
R1 = 0805W8F250MT5E: RES SMD 25m Ohms 125mW 0805; Manufacturer: UNI-Royal Elec; Resistance: 25mOhm; Overload Voltage (Max): 150V; Tolerance: ±1%; Temperature Coefficient: ±800ppm/℃; Type: Thick Film Resistors; ComponentLink1Description: LCSC; ComponentLink1URL: https://lcsc.com/product-detail/Chip-Resistor-Surface-Mount_UNI-ROYAL-Uniroyal-Elec-0805W8F250MT5E_C620515.html
R2 R3 = RC0402JR-071KL: as R9 on sheet Switching-Regulators; Supplier 1: Digi-Key; Manufacturer Part Number: RC0402JR-071KL; RoHS: Yes; Category: Chip SMD Resistors; Stock 1: 452315; Pricing 1: 1=0.10000, 10=0.01300, 100=0.00540, 1000=0.00244, 2500=0.00212, 5000=0.00175 (USD); Case/Package: 0402; Case Code (Imperial): 0402; Case Code (Metric): 1005; Size Code: 0402; Min Operating Temperature: -55°C; Max Operating Temperature: 155°C; Tolerance: 5%; Packaging: Tape and Reel; Package Quantity: 1; Termination: SMD/SMT; Resistor Type: Thick Film; Number of Terminations: 2; Features: Moisture Resistant; Series: RC; Resistance Tolerance: 5%; Construction: Rectangular; Length: 0.039inch; Width: 0.02inch; Height: 0.016inch; Depth: 0.5mm; REACH SVHC: No SVHC; Military Standard: Not; Lead Free: Lead Free; RoHS Compliant: Yes; ComponentLink1URL: https://datasheet.ciiva.com/7983/1018594-7983558.pdf?src-supplier=Element14; ComponentLink1Description: https://datasheet.ciiva.com/7983/1018594-7983558.pdf?src-supplier=Element14; ComponentLink2URL: https://datasheet.ciiva.com/2452/pyu-r-int-thick-7-2452756.pdf?src-supplier=Digi-Key; ComponentLink2Description: https://datasheet.ciiva.com/2452/pyu-r-int-thick-7-2452756.pdf?src-supplier=Digi-Key; ComponentLink3URL: https://datasheet.ciiva.com/2452/pyu-r-int-thick-7-2452757.pdf?src-supplier=Digi-Key; ComponentLink3Description: https://datasheet.ciiva.com/2452/pyu-r-int-thick-7-2452757.pdf?src-supplier=Digi-Key; ComponentLink4URL: https://datasheet.ciiva.com/2452/pyu-r-int-thick-7-2452755.pdf?src-supplier=Digi-Key; ComponentLink4Description: https://datasheet.ciiva.com/2452/pyu-r-int-thick-7-2452755.pdf?src-supplier=Digi-Key; ComponentLink5URL: https://datasheet.ciiva.com/7850/1018594-7850170.pdf?src-supplier=Element14; ComponentLink5Description: https://datasheet.ciiva.com/7850/1018594-7850170.pdf?src-supplier=Element14; ComponentLink6URL: https://datasheet.ciiva.com/7850/1018594-7850171.pdf?src-supplier=Element14; ComponentLink6Description: https://datasheet.ciiva.com/7850/1018594-7850171.pdf?src-supplier=Element14; ComponentLink7URL: https://datasheet.ciiva.com/17081/pyu-rc0402-51-rohs-l-6-r-17081438.pdf?src-supplier=Future+Electronics; ComponentLink7Description: https://datasheet.ciiva.com/17081/pyu-rc0402-51-rohs-l-6-r-17081438.pdf?src-supplier=Future+Electronics; Supplier Part Number 1: 311-1.0KJRCT-ND
R17 = ERJPA2F1003X: as R26 on sheet Switching-Regulators; Supplier 1: Digi-Key; Stock 1: 8829; Pricing 1: 1=0.21, 10=0.175, 100=0.0686, 1000=0.02871, 2500=0.02632, 5000=0.02393 (USD); Case/Package: 0402; Case Code (Metric): 1005; Case Code (Imperial): 0402; Min Operating Temperature: -55°C; Max Operating Temperature: 155°C; Packaging: Cut Tape; Composition: Thick Film; Number of Terminations: 2; Tolerance: 1%; Max Power Dissipation: 200mW; Voltage Rating (DC): 50V; Features: Automotive AEC-Q200; Length: 0.039inch; Height: 0.016inch; Width: 0.02inch; REACH SVHC: Unknown; ComponentLink1URL: http://www.farnell.com/datasheets/2051174.pdf?src-supplier=Element14; ComponentLink1Description: http://www.farnell.com/datasheets/2051174.pdf?src-supplier=Element14; ComponentLink2URL: https://industrial.panasonic.com/ww/system/files/data/download/catalog/id_fixed-resistors_e_1.pdf?src-supplier=Digi-Key; ComponentLink2Description: https://industrial.panasonic.com/ww/system/files/data/download/catalog/id_fixed-resistors_e_1.pdf?src-supplier=Digi-Key; Supplier Part Number 1: P17236CT-ND
R18 R19 = RC0402FR-0710KL: as R4 on sheet Switching-Regulators; Supplier 1: Digi-Key; Manufacturer Part Number: RC0402FR-0710KL; Stock 1: 60122563; Pricing 1: 1=0.1, 10=0.016, 100=0.0064, 1000=0.00289, 2500=0.00251, 5000=0.00207 (USD); Case/Package: 0402; Number of Pins: 2; Case Code (Imperial): 0402; Case Code (Metric): 1005; Min Operating Temperature: -55°C; Max Operating Temperature: 155°C; Composition: Thick Film; Tolerance: 1%; Packaging: Tape and Reel; Voltage Rating: 50V; Termination: SMD/SMT; Military Standard: Not; Working Voltage: 50V; Number of Terminations: 2; Length: 1mm; Height: 0.32mm; Width: 0.5mm; Depth: 0.5mm; Lead Pitch: 0.2mm; REACH SVHC: No SVHC; Lead Free: Lead Free; ComponentLink1URL: http://www.farnell.com/datasheets/2167052.pdf?src-supplier=Element14; ComponentLink1Description: http://www.farnell.com/datasheets/2167052.pdf?src-supplier=Element14; ComponentLink2URL: http://www.farnell.com/datasheets/1686128.pdf?src-supplier=Element14; ComponentLink2Description: http://www.farnell.com/datasheets/1686128.pdf?src-supplier=Element14; ComponentLink3URL: http://www.farnell.com/datasheets/1784430.pdf?src-supplier=Element14; ComponentLink3Description: http://www.farnell.com/datasheets/1784430.pdf?src-supplier=Element14; ComponentLink4URL: http://www.yageo.com/documents/recent/PYu-RC_Group_51_RoHS_L_9.pdf?src-supplier=Mouser; ComponentLink4Description: http://www.yageo.com/documents/recent/PYu-RC_Group_51_RoHS_L_9.pdf?src-supplier=Mouser; Supplier Part Number 1: 311-10.0KLRDKR-ND
U1 = MP2615CGQ-Z: 2.1A, 1- OR 2-CELL LI-ION BATTER; Manufacturer: Monolithic Power Systems; Supplier 1: Digi-Key; Manufacturer Part Number: MP2615CGQ-Z; RoHS: No; Category: Uncategorized; Stock 1: 5000; Pricing 1: 1=2.38000, 10=2.13500, 25=2.01400, 100=1.71590, 250=1.61120, 500=1.40980, 1000=1.16812, 2500=1.14000 (USD); Supplier Part Number 1: 1589-MP2615CGQ-ZCT-ND